# Altium schematic sheet Digital_OUT.SchDoc
size A3; ENG_APP_DATE: --/--/--; DSN_APP_DATE: --/--/--; CHK_APP_DATE: --/--/--
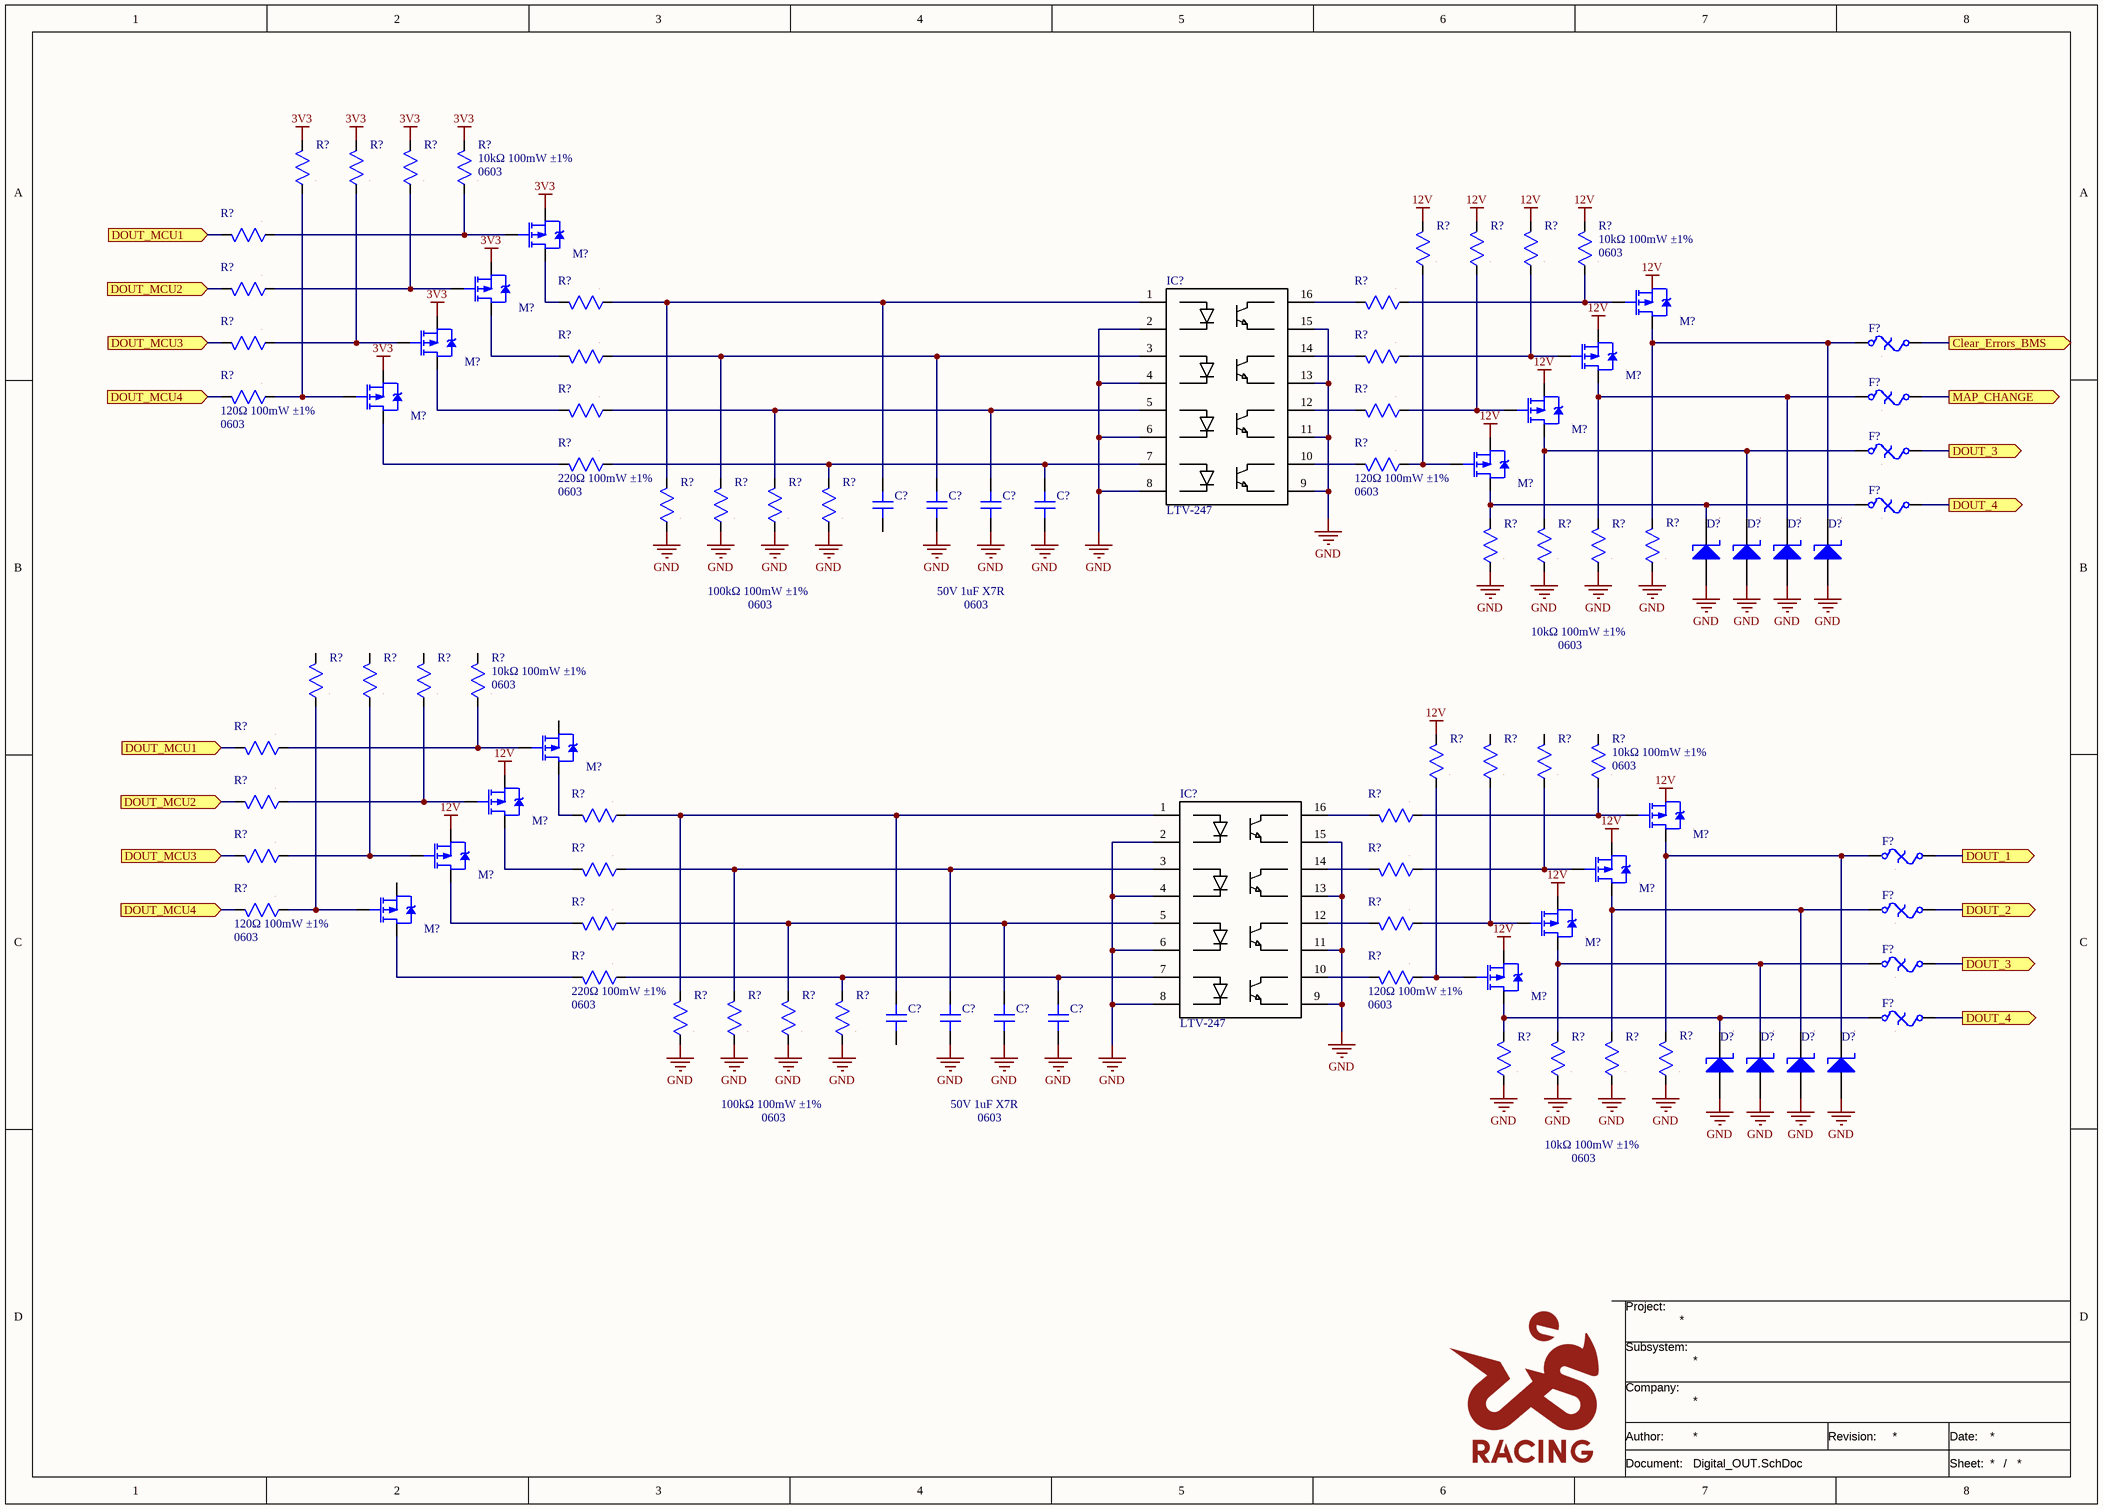
[diagram p0: Digital_OUT.SchDoc]

## Parts
(Parts that share a designator on the sheet are numbered #1, #2 ... from top to bottom, then left to right.)
C?#1  value 50V 1uF X7R  Package: 0603  [CAP SMD 0603]  (hidden comment: CAP non polarized)
C?#2  CAP non polarized  [CAP SMD 0603]  (value not drawn)
C?#3  CAP non polarized  [CAP SMD 0603]  (value not drawn)
C?#4  CAP non polarized  [CAP SMD 0603]  (value not drawn)
C?#5  value 50V 1uF X7R  Package: 0603  [CAP SMD 0603]  (hidden comment: CAP non polarized)
C?#6  CAP non polarized  [CAP SMD 0603]  (value not drawn)
C?#7  CAP non polarized  [CAP SMD 0603]  (value not drawn)
C?#8  CAP non polarized  [CAP SMD 0603]  (value not drawn)
D?#1  DIODE SCHOTTKY  [DO-214AB]  (value not drawn)
D?#2  DIODE SCHOTTKY  [DO-214AB]  (value not drawn)
D?#3  DIODE SCHOTTKY  [DO-214AB]  (value not drawn)
D?#4  DIODE SCHOTTKY  [DO-214AB]  (value not drawn)
D?#5  DIODE SCHOTTKY  [DO-214AB]  (value not drawn)
D?#6  DIODE SCHOTTKY  [DO-214AB]  (value not drawn)
D?#7  DIODE SCHOTTKY  [DO-214AB]  (value not drawn)
D?#8  DIODE SCHOTTKY  [DO-214AB]  (value not drawn)
F?#1  FUSE  [FUSE SMD 1206]  (value not drawn)
F?#2  FUSE  [FUSE SMD 1206]  (value not drawn)
F?#3  FUSE  [FUSE SMD 1206]  (value not drawn)
F?#4  FUSE  [FUSE SMD 1206]  (value not drawn)
F?#5  FUSE  [FUSE SMD 1206]  (value not drawn)
F?#6  FUSE  [FUSE SMD 1206]  (value not drawn)
F?#7  FUSE  [FUSE SMD 1206]  (value not drawn)
F?#8  FUSE  [FUSE SMD 1206]  (value not drawn)
IC?#1  LTV-247  [SOP-16]
IC?#2  LTV-247  [SOP-16]
M?#1  MOSFET P  [SOT-23]  (value not drawn)
M?#2  MOSFET P  [SOT-23]  (value not drawn)
M?#3  MOSFET P  [SOT-23]  (value not drawn)
M?#4  MOSFET P  [SOT-23]  (value not drawn)
M?#5  MOSFET P  [SOT-23]  (value not drawn)
M?#6  MOSFET P  [SOT-23]  (value not drawn)
M?#7  MOSFET P  [SOT-23]  (value not drawn)
M?#8  MOSFET P  [SOT-23]  (value not drawn)
M?#9  MOSFET P  [SOT-23]  (value not drawn)
M?#10  MOSFET P  [SOT-23]  (value not drawn)
M?#11  MOSFET P  [SOT-23]  (value not drawn)
M?#12  MOSFET P  [SOT-23]  (value not drawn)
M?#13  MOSFET P  [SOT-23]  (value not drawn)
M?#14  MOSFET P  [SOT-23]  (value not drawn)
M?#15  MOSFET P  [SOT-23]  (value not drawn)
M?#16  MOSFET P  [SOT-23]  (value not drawn)
R?#1  RES  [RES SMD 0603]  (value not drawn)
R?#2  RES  [RES SMD 0603]  (value not drawn)
R?#3  RES  [RES SMD 0603]  (value not drawn)
R?#4  value 10kΩ 100mW ±1%  Package: 0603  [RES SMD 0603]  (hidden comment: RES)
R?#5  RES  [RES SMD 0603]  (value not drawn)
R?#6  RES  [RES SMD 0603]  (value not drawn)
R?#7  RES  [RES SMD 0603]  (value not drawn)
R?#8  RES  [RES SMD 0603]  (value not drawn)
R?#9  value 10kΩ 100mW ±1%  Package: 0603  [RES SMD 0603]  (hidden comment: RES)
R?#10  RES  [RES SMD 0603]  (value not drawn)
R?#11  RES  [RES SMD 0603]  (value not drawn)
R?#12  RES  [RES SMD 0603]  (value not drawn)
R?#13  RES  [RES SMD 0603]  (value not drawn)
R?#14  RES  [RES SMD 0603]  (value not drawn)
R?#15  RES  [RES SMD 0603]  (value not drawn)
R?#16  value 120Ω 100mW ±1%  Package: 0603  [RES SMD 0603]  (hidden comment: RES)
R?#17  RES  [RES SMD 0603]  (value not drawn)
R?#18  RES  [RES SMD 0603]  (value not drawn)
R?#19  value 220Ω 100mW ±1%  Package: 0603  [RES SMD 0603]  (hidden comment: RES)
R?#20  value 120Ω 100mW ±1%  Package: 0603  [RES SMD 0603]  (hidden comment: RES)
R?#21  value 100kΩ 100mW ±1%  Package: 0603  [RES SMD 0603]  (hidden comment: RES)
R?#22  RES  [RES SMD 0603]  (value not drawn)
R?#23  RES  [RES SMD 0603]  (value not drawn)
R?#24  RES  [RES SMD 0603]  (value not drawn)
R?#25  RES  [RES SMD 0603]  (value not drawn)
R?#26  RES  [RES SMD 0603]  (value not drawn)
R?#27  RES  [RES SMD 0603]  (value not drawn)
R?#28  value 10kΩ 100mW ±1%  Package: 0603  [RES SMD 0603]  (hidden comment: RES)
R?#29  RES  [RES SMD 0603]  (value not drawn)
R?#30  RES  [RES SMD 0603]  (value not drawn)
R?#31  RES  [RES SMD 0603]  (value not drawn)
R?#32  value 10kΩ 100mW ±1%  Package: 0603  [RES SMD 0603]  (hidden comment: RES)
R?#33  RES  [RES SMD 0603]  (value not drawn)
R?#34  RES  [RES SMD 0603]  (value not drawn)
R?#35  RES  [RES SMD 0603]  (value not drawn)
R?#36  RES  [RES SMD 0603]  (value not drawn)
R?#37  value 10kΩ 100mW ±1%  Package: 0603  [RES SMD 0603]  (hidden comment: RES)
R?#38  RES  [RES SMD 0603]  (value not drawn)
R?#39  RES  [RES SMD 0603]  (value not drawn)
R?#40  RES  [RES SMD 0603]  (value not drawn)
R?#41  RES  [RES SMD 0603]  (value not drawn)
R?#42  RES  [RES SMD 0603]  (value not drawn)
R?#43  RES  [RES SMD 0603]  (value not drawn)
R?#44  value 120Ω 100mW ±1%  Package: 0603  [RES SMD 0603]  (hidden comment: RES)
R?#45  RES  [RES SMD 0603]  (value not drawn)
R?#46  RES  [RES SMD 0603]  (value not drawn)
R?#47  value 220Ω 100mW ±1%  Package: 0603  [RES SMD 0603]  (hidden comment: RES)
R?#48  value 120Ω 100mW ±1%  Package: 0603  [RES SMD 0603]  (hidden comment: RES)
R?#49  value 100kΩ 100mW ±1%  Package: 0603  [RES SMD 0603]  (hidden comment: RES)
R?#50  RES  [RES SMD 0603]  (value not drawn)
R?#51  RES  [RES SMD 0603]  (value not drawn)
R?#52  RES  [RES SMD 0603]  (value not drawn)
R?#53  RES  [RES SMD 0603]  (value not drawn)
R?#54  RES  [RES SMD 0603]  (value not drawn)
R?#55  RES  [RES SMD 0603]  (value not drawn)
R?#56  value 10kΩ 100mW ±1%  Package: 0603  [RES SMD 0603]  (hidden comment: RES)

## Ports
Clear_Errors_BMS (out), DOUT_1 (out), DOUT_2 (out), DOUT_3 (out), DOUT_4 (out), DOUT_MCU1 (in), DOUT_MCU2 (in), DOUT_MCU3 (in), DOUT_MCU4 (in), MAP_CHANGE (out)

## Nets
3V3: M?#1.2(S) M?#2.2(S) M?#4.2(S) M?#6.2(S) R?#1.2 R?#2.2 R?#3.2 R?#4.2
12V: M?#5.2(S) M?#7.2(S) M?#8.2(S) M?#10.2(S) M?#12.2(S) M?#13.2(S) M?#15.2(S) M?#16.2(S) R?#6.2 R?#7.2 R?#8.2 R?#9.2 R?#34.2
GND: C?#2.2 C?#3.2 C?#4.2 C?#6.2 C?#7.2 C?#8.2 D?#1.A D?#2.A D?#3.A D?#4.A D?#5.A D?#6.A D?#7.A D?#8.A IC?#1.2(K_1) IC?#1.4(K_2) IC?#1.6(K_3) IC?#1.8(K_4) IC?#1.9(E_4) IC?#1.11(E_3) IC?#1.13(E_2) IC?#1.15(E_1) IC?#2.2(K_1) IC?#2.4(K_2) IC?#2.6(K_3) IC?#2.8(K_4) IC?#2.9(E_4) IC?#2.11(E_3) IC?#2.13(E_2) IC?#2.15(E_1) R?#21.1 R?#22.1 R?#23.1 R?#24.1 R?#25.1 R?#26.1 R?#27.1 R?#28.1 R?#49.1 R?#50.1 R?#51.1 R?#52.1 R?#53.1 R?#54.1 R?#55.1 R?#56.1
Clear_Errors_BMS: F?#1.2 ; port Clear_Errors_BMS
DOUT_1: F?#5.2 ; port DOUT_1
DOUT_2: F?#6.2 ; port DOUT_2
DOUT_3: F?#3.2 F?#7.2 ; port DOUT_3
DOUT_4: F?#4.2 F?#8.2 ; port DOUT_4
DOUT_MCU1: R?#5.2 R?#33.2 ; port DOUT_MCU1
DOUT_MCU2: R?#10.2 R?#38.2 ; port DOUT_MCU2
DOUT_MCU3: R?#13.2 R?#41.2 ; port DOUT_MCU3
DOUT_MCU4: R?#16.2 R?#44.2 ; port DOUT_MCU4
MAP_CHANGE: F?#2.2 ; port MAP_CHANGE
NetC?#1_1: C?#1.1 IC?#1.1(A_1) R?#11.1 R?#21.2
NetC?#2_1: C?#2.1 IC?#1.3(A_2) R?#14.1 R?#22.2
NetC?#3_1: C?#3.1 IC?#1.5(A_3) R?#17.1 R?#23.2
NetC?#4_1: C?#4.1 IC?#1.7(A_4) R?#19.1 R?#24.2
NetC?#5_1: C?#5.1 IC?#2.1(A_1) R?#39.1 R?#49.2
NetC?#6_1: C?#6.1 IC?#2.3(A_2) R?#42.1 R?#50.2
NetC?#7_1: C?#7.1 IC?#2.5(A_3) R?#45.1 R?#51.2
NetC?#8_1: C?#8.1 IC?#2.7(A_4) R?#47.1 R?#52.2
NetD?#1_K: D?#1.K F?#4.1 M?#8.3(D) R?#25.2
NetD?#2_K: D?#2.K F?#3.1 M?#7.3(D) R?#26.2
NetD?#3_K: D?#3.K F?#2.1 M?#5.3(D) R?#27.2
NetD?#4_K: D?#4.K F?#1.1 M?#3.3(D) R?#28.2
NetD?#5_K: D?#5.K F?#8.1 M?#16.3(D) R?#53.2
NetD?#6_K: D?#6.K F?#7.1 M?#15.3(D) R?#54.2
NetD?#7_K: D?#7.K F?#6.1 M?#13.3(D) R?#55.2
NetD?#8_K: D?#8.K F?#5.1 M?#11.3(D) R?#56.2
NetIC?#1_10: IC?#1.10(C_4) R?#20.2
NetIC?#1_12: IC?#1.12(C_3) R?#18.2
NetIC?#1_14: IC?#1.14(C_2) R?#15.2
NetIC?#1_16: IC?#1.16(C_1) R?#12.2
NetIC?#2_10: IC?#2.10(C_4) R?#48.2
NetIC?#2_12: IC?#2.12(C_3) R?#46.2
NetIC?#2_14: IC?#2.14(C_2) R?#43.2
NetIC?#2_16: IC?#2.16(C_1) R?#40.2
NetM?#1_1: M?#1.1(G) R?#4.1 R?#5.1
NetM?#1_3: M?#1.3(D) R?#11.2
NetM?#2_1: M?#2.1(G) R?#3.1 R?#10.1
NetM?#2_3: M?#2.3(D) R?#14.2
NetM?#3_1: M?#3.1(G) R?#9.1 R?#12.1
NetM?#4_1: M?#4.1(G) R?#2.1 R?#13.1
NetM?#4_3: M?#4.3(D) R?#17.2
NetM?#5_1: M?#5.1(G) R?#8.1 R?#15.1
NetM?#6_1: M?#6.1(G) R?#1.1 R?#16.1
NetM?#6_3: M?#6.3(D) R?#19.2
NetM?#7_1: M?#7.1(G) R?#7.1 R?#18.1
NetM?#8_1: M?#8.1(G) R?#6.1 R?#20.1
NetM?#9_1: M?#9.1(G) R?#32.1 R?#33.1
NetM?#9_3: M?#9.3(D) R?#39.2
NetM?#10_1: M?#10.1(G) R?#31.1 R?#38.1
NetM?#10_3: M?#10.3(D) R?#42.2
NetM?#11_1: M?#11.1(G) R?#37.1 R?#40.1
NetM?#12_1: M?#12.1(G) R?#30.1 R?#41.1
NetM?#12_3: M?#12.3(D) R?#45.2
NetM?#13_1: M?#13.1(G) R?#36.1 R?#43.1
NetM?#14_1: M?#14.1(G) R?#29.1 R?#44.1
NetM?#14_3: M?#14.3(D) R?#47.2
NetM?#15_1: M?#15.1(G) R?#35.1 R?#46.1
NetM?#16_1: M?#16.1(G) R?#34.1 R?#48.1

Not connected (* = marked no-connect by the designer): C?#1 2; C?#5 2; M?#3 2(S); M?#9 2(S); M?#11 2(S); M?#14 2(S); R?#29 2; R?#30 2; R?#31 2; R?#32 2; R?#35 2; R?#36 2; R?#37 2

## Notes on the sheet
- Labels drawn without touching a wire or pin: 12V
- Project:
- Subsystem:
- Company:
- Document:
- Author:
- Revision:
- Date:
- Sheet:
- /

## Library data of the parts
C?#1 C?#4 C?#5 C?#8 = 001-0102: Condensadores de cerámica multicapa (MLCC- SMD/SMT) WCAP-CSGP 1uF 50 Vol 10%; MPN: 885012206126; Manufacturer: Wurth Elektronik; ComponentLink1Description: Datasheet; ComponentLink1URL: https://www.we-online.com/components/products/datasheet/885012206126.pdf; ComponentLink2Description: Distributor Link; ComponentLink2URL: https://www.mouser.es/ProductDetail/Wurth-Elektronik/885012206126?qs=amGC7iS6iy%2F%252BJOLb%2FSuwig%3D%3D; ID: 001-0102; Distributor PN: 710-885012206126; Distributor: Mouser
C?#2 C?#3 C?#6 C?#7 = 001-0102: Condensadores de cerámica multicapa (MLCC- SMD/SMT) WCAP-CSGP 1uF 50 Vol 10%; MPN: 885012206126; Manufacturer: Wurth Elektronik; Value: 50V 1uF X7R; ComponentLink1Description: Datasheet; ComponentLink1URL: https://www.we-online.com/components/products/datasheet/885012206126.pdf; ComponentLink2Description: Distributor Link; ComponentLink2URL: https://www.mouser.es/ProductDetail/Wurth-Elektronik/885012206126?qs=amGC7iS6iy%2F%252BJOLb%2FSuwig%3D%3D; Package: 0603; ID: 001-0102; Distributor PN: 710-885012206126; Distributor: Mouser
D?#1-D?#8 = 031-0013: Diodos y rectificadores Schottky 3A 60V; MPN: MBRS360T3G; Manufacturer: onsemi; Value: 60V 3A; ComponentLink1Description: Datasheet; ComponentLink1URL: https://www.onsemi.com/pdf/datasheet/mbrs360t3-d.pdf; ComponentLink2Description: Distributor Link; ComponentLink2URL: https://www.mouser.es/ProductDetail/onsemi/MBRS360T3G?qs=3JMERSakebpuPnGIg0cvPA%3D%3D; ID: 031-0013; Package: DO-214AB; Distributor PN: 863-MBRS360T3G; Distributor: Mouser
F?#1-F?#8 = 040-0023: Fusibles de montaje en superficie 63V 1A FA HALIDE FREE SLIM; MPN: 0466001.NRHF; Manufacturer: Littelfuse; ComponentLink1Description: Datasheet; ComponentLink1URL: https://www.littelfuse.com/assetdocs/littelfuse_fuse_466_datasheet?assetguid=dbe9bcd7-6072-4adf-bf5b-d33e52a6b90f; ComponentLink2Description: Distributor Link; ComponentLink2URL: https://www.mouser.es/ProductDetail/Littelfuse/0466001.NRHF?qs=n5MbhIql%252BRl7ALFy%2FbHisA%3D%3D; ID: 040-0023; Value: 1A; Package: 1206; Distributor PN: 576-0466001.NRHF; Distributor: Mouser
IC?#1 IC?#2 = 041-0002: Optoacopladores para salidas de transistores PTR 50% 5KV 16 PIN 4CH Optocoupler; Manufacturer: LITEON; ComponentLink1Description: Datasheet; ComponentLink1URL: https://www.mouser.com/catalog/specsheets/Lite-On-07-31-2018-LTV-2X7%20sereis%20Apr18.pdf?_gl=1*hv8h7o*_gcl_aw*R0NMLjE3ODA5NDM2MTUuQ2owS0NRancwSm5SQmhESkFSSXNBTG9iblhiTVZmV3NWb0pqSGVpNWRkTXk2SzRuNEhwRGVRWXYxa0dMT0s1N0VWSjRWQlE1eFhBYUoxd2FBa3NuRUFMd193Y0I.*_gcl_au*MjAyMjI4MzgwOS4xNzc1NDk0ODAwLjEzNjA3ODI2NzguMTc4MzExMDAxNi4xNzgzMTEwMDE2*_ga*Nzg3Njk5NTY0LjE3NDY2Mzg0MjI.*_ga_15W4STQT4T*czE3ODMxMTAwMTYkbzEzNyRnMSR0MTc4MzExMDAxOSRqNTckbDAkaDA.; ComponentLink2Description: Distributor Link; ComponentLink2URL: https://www.mouser.es/ProductDetail/LITEON/LTV-247?qs=9ayhpukWNmvWpoxQBzWkFA%3D%3D; ID: 041-0002; Value: -; Package: SOP-16; MPN: LTV-247; Distributor PN: 859-LTV-247; Distributor: Mouser
M?#1-M?#16 = 043-0002: MOSFET -30V Vds 20V Vgs SOT-23; MPN: SI2303CDS-T1-GE3; Manufacturer: Vishay Semiconductors; ComponentLink1Description: Datasheet; ComponentLink1URL: https://www.vishay.com/docs/69991/si2303cd.pdf; ComponentLink2Description: Distributor Link; ComponentLink2URL: https://www.mouser.es/ProductDetail/Vishay-Semiconductors/SI2303CDS-T1-GE3?qs=IRuQNBqMOckJHxNXLRBkmw%3D%3D; ID: 043-0002; Value: P; Package: SOT-23-3; Distributor PN: 781-SI2303CDS-T1-GE3; Distributor: Mouser
R?#1-R?#3 R?#6-R?#8 R?#25-R?#27 R?#29-R?#31 R?#34-R?#36 R?#53-R?#55 = 010-0145: Resistores de película gruesa - SMD WRIS-RSKS 10 kOhms 1 % 0.1 W 0603 AEC-Q200; MPN: 560112116005; Manufacturer: Wurth Elektronik; Value: 10kΩ 100mW ±1%; ComponentLink1Description: Datasheet; ComponentLink1URL: https://www.we-online.com/components/products/datasheet/560112116005.pdf; ComponentLink2Description: Distributor Link; ComponentLink2URL: https://www.mouser.es/ProductDetail/Wurth-Elektronik/560112116005?qs=mELouGlnn3dMVSPHwBGouA%3D%3D; Package: 0603; ID: 010-0145; Distributor PN: 710-560112116005; Distributor: Mouser
R?#4 R?#9 R?#28 R?#32 R?#37 R?#56 = 010-0145: Resistores de película gruesa - SMD WRIS-RSKS 10 kOhms 1 % 0.1 W 0603 AEC-Q200; MPN: 560112116005; Manufacturer: Wurth Elektronik; ComponentLink1Description: Datasheet; ComponentLink1URL: https://www.we-online.com/components/products/datasheet/560112116005.pdf; ComponentLink2Description: Distributor Link; ComponentLink2URL: https://www.mouser.es/ProductDetail/Wurth-Elektronik/560112116005?qs=mELouGlnn3dMVSPHwBGouA%3D%3D; ID: 010-0145; Distributor PN: 710-560112116005; Distributor: Mouser
R?#5 R?#10 R?#12 R?#13 R?#15 R?#18 R?#33 R?#38 R?#40 R?#41 R?#43 R?#46 = 010-0177: Resistores de película gruesa - SMD WRIS-RSKS 120 Ohms 1 % 0.1 W 0603 AEC-Q200; MPN: 560112116119; Manufacturer: Wurth Elektronik; Value: 120Ω 100mW ±1%; ComponentLink1Description: Datasheet; ComponentLink1URL: https://www.we-online.com/components/products/datasheet/560112116119.pdf; ComponentLink2Description: Distributor Link; ComponentLink2URL: https://www.mouser.es/ProductDetail/Wurth-Elektronik/560112116119?qs=mELouGlnn3eT%2F22oIMY8Ng%3D%3D; Package: 0603; ID: 010-0177; Distributor PN: 710-560112116119; Distributor: Mouser
R?#11 R?#14 R?#17 R?#39 R?#42 R?#45 = 010-0191: Resistores de película gruesa - SMD WRIS-RSKS 220 Ohms 1 % 0.1 W 0603 AEC-Q200; MPN: 560112116126; Manufacturer: Wurth Elektronik; Value: 220Ω 100mW ±1%; ComponentLink1Description: Datasheet; ComponentLink1URL: https://www.we-online.com/components/products/datasheet/560112116126.pdf; ComponentLink2Description: Distributor Link; Package: 0603; ID: 010-0191; Distributor PN: 710-560112116126; Distributor: Mouser
R?#16 R?#20 R?#44 R?#48 = 010-0177: Resistores de película gruesa - SMD WRIS-RSKS 120 Ohms 1 % 0.1 W 0603 AEC-Q200; MPN: 560112116119; Manufacturer: Wurth Elektronik; ComponentLink1Description: Datasheet; ComponentLink1URL: https://www.we-online.com/components/products/datasheet/560112116119.pdf; ComponentLink2Description: Distributor Link; ComponentLink2URL: https://www.mouser.es/ProductDetail/Wurth-Elektronik/560112116119?qs=mELouGlnn3eT%2F22oIMY8Ng%3D%3D; ID: 010-0177; Distributor PN: 710-560112116119; Distributor: Mouser
R?#19 R?#47 = 010-0191: Resistores de película gruesa - SMD WRIS-RSKS 220 Ohms 1 % 0.1 W 0603 AEC-Q200; MPN: 560112116126; Manufacturer: Wurth Elektronik; ComponentLink1Description: Datasheet; ComponentLink1URL: https://www.we-online.com/components/products/datasheet/560112116126.pdf; ComponentLink2Description: Distributor Link; ID: 010-0191; Distributor PN: 710-560112116126; Distributor: Mouser
R?#21 R?#24 R?#49 R?#52 = 010-0190: Thick Film Resistors WRIS-RSKS 100 kOhms 1 % 0.1 W 0603 AEC-Q200; MPN: 560112116004; Manufacturer: Wurth Elektronik; ComponentLink1Description: Datasheet; ComponentLink1URL: https://www.we-online.com/components/products/datasheet/560112116004.pdf; ComponentLink2Description: Distributor Link; ComponentLink2URL: https://www.mouser.es/ProductDetail/Wurth-Elektronik/560112116004?qs=sGAEpiMZZMvdGkrng054txLI%2FDB4oIKDB%252BmfBE1ySSGuQklCN21gzA%3D%3D; ID: 010-0190; Distributor PN: 710-560112116004; Distributor: Mouser
R?#22 R?#23 R?#50 R?#51 = 010-0190: Thick Film Resistors WRIS-RSKS 100 kOhms 1 % 0.1 W 0603 AEC-Q200; MPN: 560112116004; Manufacturer: Wurth Elektronik; Value: 100kΩ 100mW ±1%; ComponentLink1Description: Datasheet; ComponentLink1URL: https://www.we-online.com/components/products/datasheet/560112116004.pdf; ComponentLink2Description: Distributor Link; ComponentLink2URL: https://www.mouser.es/ProductDetail/Wurth-Elektronik/560112116004?qs=sGAEpiMZZMvdGkrng054txLI%2FDB4oIKDB%252BmfBE1ySSGuQklCN21gzA%3D%3D; Package: 0603; ID: 010-0190; Distributor PN: 710-560112116004; Distributor: Mouser